# Altium project Main_Board.PrjPcb (part 10 of 44)

## Sheet Bank223.SchDoc: Bank223
size A3; Organization: Altium Limited; Address1: L3, 12a Rodborough Rd; Address2: Frenchs Forest; Address3: NSW; Address4: Australia 2086
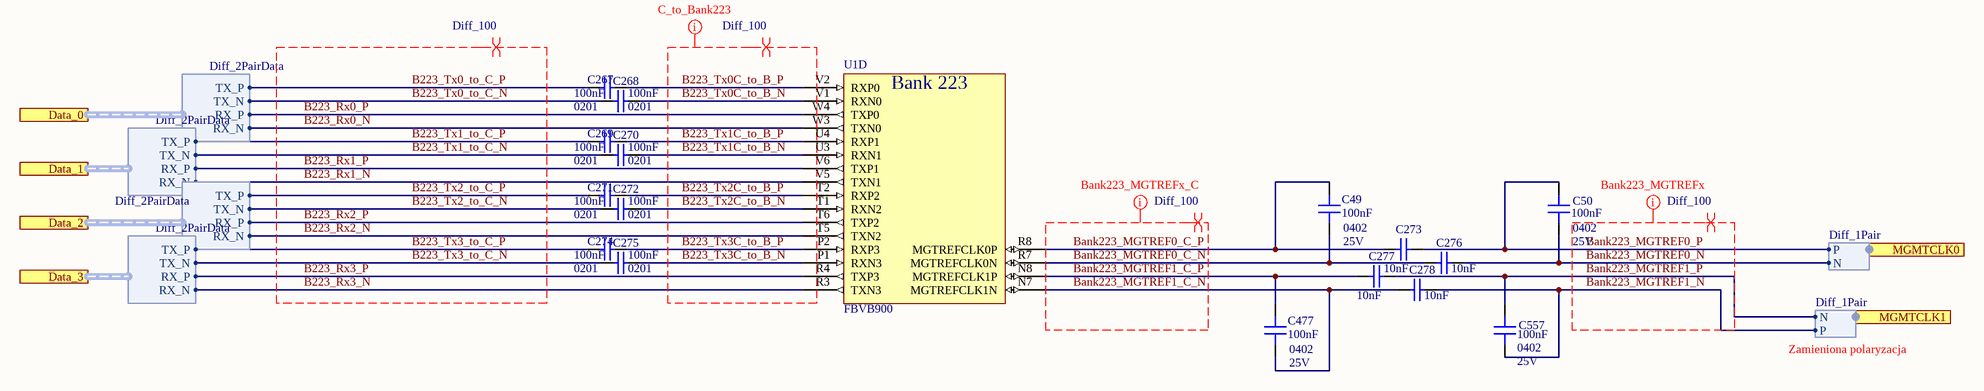
[diagram p15: Bank223.SchDoc]

### Parts
(Parts that share a designator on the sheet are numbered #1, #2 ... from top to bottom, then left to right.)
C49  100nF  Case/Package: 0402  Voltage Rating: 25V  [CAP 0402/1005 KK]
C50  100nF  Case/Package: 0402  Voltage Rating: 25V  [CAP 0402/1005 KK]
C267  100nF  Case/Package: 0201  [CAP 0201/0603 KK]
C268  100nF  Case/Package: 0201  [CAP 0201/0603 KK]
C269  100nF  Case/Package: 0201  [CAP 0201/0603 KK]
C270  100nF  Case/Package: 0201  [CAP 0201/0603 KK]
C271  100nF  Case/Package: 0201  [CAP 0201/0603 KK]
C272  100nF  Case/Package: 0201  [CAP 0201/0603 KK]
C273  10nF  [CAP 0201/0603 KK]
C274  100nF  Case/Package: 0201  [CAP 0201/0603 KK]
C275  100nF  Case/Package: 0201  [CAP 0201/0603 KK]
C276  10nF  [CAP 0201/0603 KK]
C277  10nF  [CAP 0201/0603 KK]
C278  10nF  [CAP 0201/0603 KK]
C477#1  100nF  Case/Package: 0402  Voltage Rating: 25V  [CAP 0402/1005 KK]
C557  100nF  Case/Package: 0402  Voltage Rating: 25V  [CAP 0402/1005 KK]
U1  FBVB900  [FBVB900 XX]  (part D of 23)

### Ports
Data_0 (harness Diff_2PairData), Data_1 (harness Diff_2PairData), Data_2 (harness Diff_2PairData), Data_3 (harness Diff_2PairData), MGMTCLK0 (harness Diff_1Pair), MGMTCLK1 (harness Diff_1Pair)

### Harnesses
Diff_1Pair: P, N
Diff_2PairData: RX_P, RX_N, TX_P, TX_N

### Nets
B223_Rx0_N: U1.W3(TXN0) ; port Data_0.RX_N
B223_Rx0_P: U1.W4(TXP0) ; port Data_0.RX_P
B223_Rx1_N: U1.V5(TXN1) ; port Data_1.RX_N
B223_Rx1_P: U1.V6(TXP1) ; port Data_1.RX_P
B223_Rx2_N: U1.T5(TXN2) ; port Data_2.RX_N
B223_Rx2_P: U1.T6(TXP2) ; port Data_2.RX_P
B223_Rx3_N: U1.R3(TXN3) ; port Data_3.RX_N
B223_Rx3_P: U1.R4(TXP3) ; port Data_3.RX_P
B223_Tx0_to_C_N: C268.1 ; port Data_0.TX_N
B223_Tx0_to_C_P: C267.1 ; port Data_0.TX_P
B223_Tx0C_to_B_N: C268.2 U1.V1(RXN0)
B223_Tx0C_to_B_P: C267.2 U1.V2(RXP0)
B223_Tx1_to_C_N: C270.1 ; port Data_1.TX_N
B223_Tx1_to_C_P: C269.1 ; port Data_1.TX_P
B223_Tx1C_to_B_N: C270.2 U1.U3(RXN1)
B223_Tx1C_to_B_P: C269.2 U1.U4(RXP1)
B223_Tx2_to_C_N: C272.1 ; port Data_2.TX_N
B223_Tx2_to_C_P: C271.1 ; port Data_2.TX_P
B223_Tx2C_to_B_N: C272.2 U1.T1(RXN2)
B223_Tx2C_to_B_P: C271.2 U1.T2(RXP2)
B223_Tx3_to_C_N: C275.1 ; port Data_3.TX_N
B223_Tx3_to_C_P: C274.1 ; port Data_3.TX_P
B223_Tx3C_to_B_N: C275.2 U1.P1(RXN3)
B223_Tx3C_to_B_P: C274.2 U1.P2(RXP3)
Bank223_MGTREF0_C_N: C49.1 C276.1 U1.R7(MGTREFCLK0N)
Bank223_MGTREF0_C_P: C49.2 C273.1 U1.R8(MGTREFCLK0P)
Bank223_MGTREF0_N: C50.1 C276.2 ; port MGMTCLK0.N
Bank223_MGTREF0_P: C50.2 C273.2 ; port MGMTCLK0.P
Bank223_MGTREF1_C_N: C278.1 C477#1.1 U1.N7(MGTREFCLK1N)
Bank223_MGTREF1_C_P: C277.1 C477#1.2 U1.N8(MGTREFCLK1P)
Bank223_MGTREF1_N: C278.2 C557.1 ; port MGMTCLK1.P
Bank223_MGTREF1_P: C277.2 C557.2 ; port MGMTCLK1.N

### Layout directives
differential pair; differential pair class Diff_100: B223_Rx0_N, B223_Rx0_P, B223_Rx1_N, B223_Rx1_P, B223_Rx2_N, B223_Rx2_P, B223_Rx3_N, B223_Rx3_P, B223_Tx0_to_C_N, B223_Tx0_to_C_P, B223_Tx0C_to_B_N, B223_Tx0C_to_B_P, B223_Tx1_to_C_N, B223_Tx1_to_C_P, B223_Tx1C_to_B_N, B223_Tx1C_to_B_P, B223_Tx2_to_C_N, B223_Tx2_to_C_P, B223_Tx2C_to_B_N, B223_Tx2C_to_B_P, B223_Tx3_to_C_N, B223_Tx3_to_C_P, B223_Tx3C_to_B_N, B223_Tx3C_to_B_P, Bank223_MGTREF0_C_N, Bank223_MGTREF0_C_P, Bank223_MGTREF0_N, Bank223_MGTREF0_P, Bank223_MGTREF1_C_N, Bank223_MGTREF1_C_P, Bank223_MGTREF1_N, Bank223_MGTREF1_P
net class C_to_Bank223: B223_Tx0C_to_B_N, B223_Tx0C_to_B_P, B223_Tx1C_to_B_N, B223_Tx1C_to_B_P, B223_Tx2C_to_B_N, B223_Tx2C_to_B_P, B223_Tx3C_to_B_N, B223_Tx3C_to_B_P
net class Bank223_MGTREFx_C: Bank223_MGTREF0_C_N, Bank223_MGTREF0_C_P, Bank223_MGTREF1_C_N, Bank223_MGTREF1_C_P
net class Bank223_MGTREFx: Bank223_MGTREF0_N, Bank223_MGTREF0_P, Bank223_MGTREF1_N, Bank223_MGTREF1_P

### Notes on the sheet
- Zamieniona polaryzacja
- Title
- Size:
- Date:
- A3
- Number:
- Time:
- Revision:
- Sheet
- of
- File:
- (in symbol FBVB900, part D) Bank 223

### Library data of the parts
C49 C50 C477#1 C557 = Capacitor: as C54 on sheet LTC6952; Supplier 1: Digi-Key; Supplier Part Number 1: 490-14603-1-ND; Stock 1: 89275; Pricing 1: 1 = 0,10000, 10 = 0,03400, 100 = 0,01520, 500 = 0,01088, 1000 = 0,00855, 2500 = 0,00778, 5000 = 0,00715 (USD); RoHS: Yes; Mount: Surface Mount; Weight: 0.000212oz; Case Code (Imperial): 0402; Case Code (Metric): 1005; Min Operating Temperature: -55°C; Max Operating Temperature: 125°C; Packaging: Tape and Reel; Capacitance: 100nF; Termination: SMD/SMT; Composition: Ceramic; Voltage Rating (DC): 25V; Package Quantity: 50000; Length: 0.039inch; Height: 0.5mm; Width: 0.5mm; Thickness: 0.022inch; ComponentLink1URL: http://www.mouser.com/ds/2/281/c02e-2905.pdf?src-supplier=Mouser; ComponentLink1Description: http://www.mouser.com/ds/2/281/c02e-2905.pdf?src-supplier=Mouser; ComponentLink2URL: http://search.murata.co.jp/Ceramy/image/img/A01X/G101/ENG/GRM155R71E104KE14-01.pdf?src-supplier=Digi-Key; ComponentLink2Description: http://search.murata.co.jp/Ceramy/image/img/A01X/G101/ENG/GRM155R71E104KE14-01.pdf?src-supplier=Digi-Key
C267-C272 C274 C275 = Capacitor: as C279 on sheet Bank224; Supplier 1: Digi-Key; Supplier Part Number 1: 490-9986-1-ND; RoHS: Yes; Category: Ceramic Capacitors; Stock 1: 519119; Pricing 1: 1=0,10000, 10=0,06000, 100=0,02670, 500=0,01906, 1000=0,01497, 2500=0,01361, 5000=0,01252 (USD); Mount: Surface Mount; Weight: 1.2E-05oz; Case Code (Metric): 0603; Min Operating Temperature: -55°C; Max Operating Temperature: 85°C; Capacitance: 100nF; Packaging: Tape and Reel; Voltage Rating: 16V; Dielectric: X5R; Termination: SMD/SMT; Voltage Rating (DC): 16V; Package Quantity: 15000; Length: 0.024inch; Height: 0.3mm; Width: 0.3mm; Thickness: 0.013inch; ComponentLink1URL: http://www.mouser.com/ds/2/281/c02e-2905.pdf?src-supplier=Mouser; ComponentLink1Description: http://www.mouser.com/ds/2/281/c02e-2905.pdf?src-supplier=Mouser; ComponentLink2URL: http://search.murata.co.jp/Ceramy/image/img/A01X/G101/ENG/GRM033R61C104ME84-01.pdf?src-supplier=Digi-Key; ComponentLink2Description: http://search.murata.co.jp/Ceramy/image/img/A01X/G101/ENG/GRM033R61C104ME84-01.pdf?src-supplier=Digi-Key
  C268 C270 C272 C275: Case Code (Imperial): 0201
C273 C276-C278 = Capacitor: as C285 on sheet Bank224; Supplier 1: Digi-Key; Supplier Part Number 1: 490-14453-1-ND; RoHS: No; Category: Ceramic Capacitors; Stock 1: 188777; Pricing 1: 1=0,10000, 10=0,01900, 100=0,00870, 500=0,00620, 1000=0,00487, 2500=0,00443, 5000=0,00407 (USD); Voltage Rating (DC): 16V; Dielectric: X7R; Capacitance: 10nF; Length: 600um; Width: 300um; Thickness: 300um; ComponentLink1URL: http://www.farnell.com/datasheets/2722745.pdf?src-supplier=Farnell; ComponentLink1Description: http://www.farnell.com/datasheets/2722745.pdf?src-supplier=Farnell; ComponentLink2URL: http://www.farnell.com/datasheets/2722745.pdf?src-supplier=Newark; ComponentLink2Description: http://www.farnell.com/datasheets/2722745.pdf?src-supplier=Newark; ComponentLink3URL: http://www.farnell.com/datasheets/2722745.pdf?src-supplier=Element14; ComponentLink3Description: http://www.farnell.com/datasheets/2722745.pdf?src-supplier=Element14; ComponentLink4URL: http://search.murata.co.jp/Ceramy/image/img/A01X/G101/ENG/GRM033R71C103KE14-01.pdf?src-supplier=Digi-Key; ComponentLink4Description: http://search.murata.co.jp/Ceramy/image/img/A01X/G101/ENG/GRM033R71C103KE14-01.pdf?src-supplier=Digi-Key
U1 = FBVB900: as U1 on sheet Ultrascale+_02; Supplier 1: Mouser; Supplier Part Number 1: 217-CZU4CG-1FBVB900E; Stock 1: 3; Pricing 1: 1=0,00000, 5=1060,70000 (USD); RoHS: No; Case/Package: FCBGA; Min Operating Temperature: 0°C; Max Operating Temperature: 100°C; Packaging: Tray; ComponentLink1URL: https://www.xilinx.com/support/documentation/data_sheets/ds891-zynq-ultrascale-plus-overview.pdf?src-supplier=Digi-Key; ComponentLink1Description: https://www.xilinx.com/support/documentation/data_sheets/ds891-zynq-ultrascale-plus-overview.pdf?src-supplier=Digi-Key; ComponentLink2URL: https://www.xilinx.com/support/documentation/data_sheets/ds925-zynq-ultrascale-plus.pdf?src-supplier=Digi-Key; ComponentLink2Description: https://www.xilinx.com/support/documentation/data_sheets/ds925-zynq-ultrascale-plus.pdf?src-supplier=Digi-Key; Supplier 2: Avnet; Supplier 3: Digi-Key; Supplier Part Number 2: XCZU4CG-1FBVB900E; Supplier Part Number 3: XCZU4CG-1FBVB900E-ND

## Sheet I2C_Bridge.SchDoc: I2C Bridge
size A4; DrawnBy: MrozW; Organization: Altium Limited; Address1: L3, 12a Rodborough Rd; Address2: Frenchs Forest; Address3: NSW; Address4: Australia 2086
Used 3 times, as channels HighSpeed/I2C_Bridge_PCIE, Ext_GPIO/I2C_Bridge_GPIO, SFP_Group+IMU/I2C_Bridge_SFP. Parts and nets are listed once, with the designators drawn on the sheet.
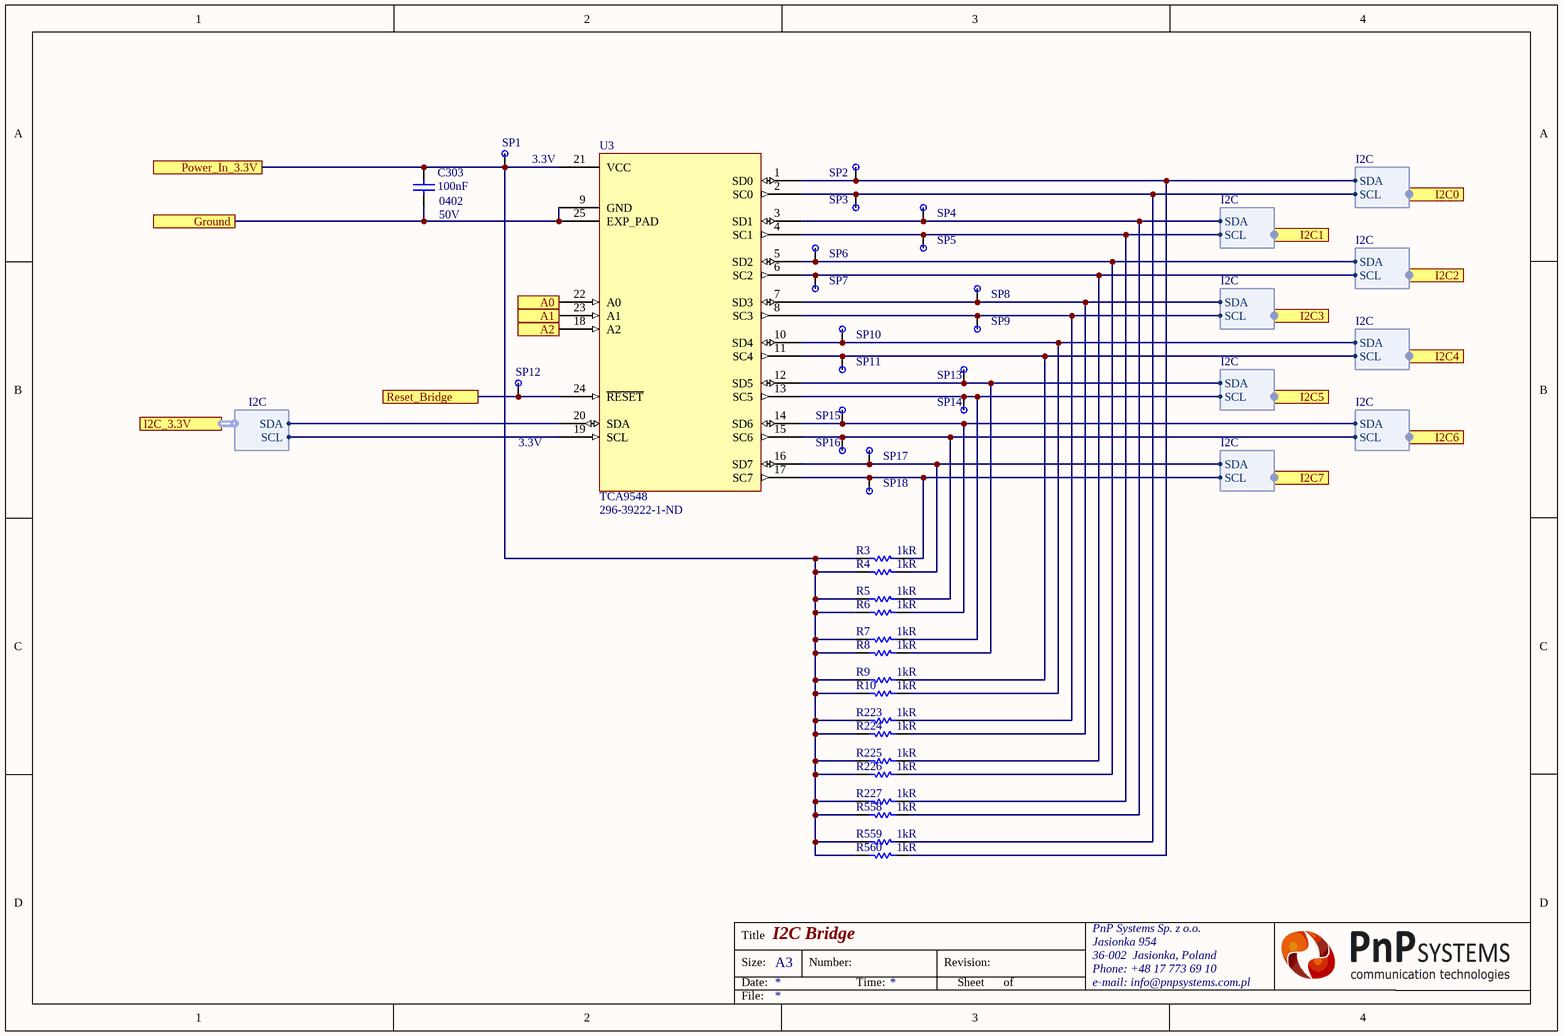
[diagram p16: I2C_Bridge.SchDoc]

### Parts
C303  100nF  Case Code (Imperial): 0402  Voltage: 50V  [CAP 0402/1005 KK]
R3  1kR  [RES 0402/1005 RF KK]
R4  1kR  [RES 0402/1005 RF KK]
R5  1kR  [RES 0402/1005 RF KK]
R6  1kR  [RES 0402/1005 RF KK]
R7  1kR  [RES 0402/1005 RF KK]
R8  1kR  [RES 0402/1005 RF KK]
R9  1kR  [RES 0402/1005 RF KK]
R10  1kR  [RES 0402/1005 RF KK]
R223  1kR  [RES 0402/1005 RF KK]
R224  1kR  [RES 0402/1005 RF KK]
R225  1kR  [RES 0402/1005 RF KK]
R226  1kR  [RES 0402/1005 RF KK]
R227  1kR  [RES 0402/1005 RF KK]
R558  1kR  [RES 0402/1005 RF KK]
R559  1kR  [RES 0402/1005 RF KK]
R560  1kR  [RES 0402/1005 RF KK]
SP1  SP  [MeasureTP]  (value not drawn)
SP2  SP  [MeasureTP]  (value not drawn)
SP3  SP  [MeasureTP]  (value not drawn)
SP4  SP  [MeasureTP]  (value not drawn)
SP5  SP  [MeasureTP]  (value not drawn)
SP6  SP  [MeasureTP]  (value not drawn)
SP7  SP  [MeasureTP]  (value not drawn)
SP8  SP  [MeasureTP]  (value not drawn)
SP9  SP  [MeasureTP]  (value not drawn)
SP10  SP  [MeasureTP]  (value not drawn)
SP11  SP  [MeasureTP]  (value not drawn)
SP12  SP  [MeasureTP]  (value not drawn)
SP13  SP  [MeasureTP]  (value not drawn)
SP14  SP  [MeasureTP]  (value not drawn)
SP15  SP  [MeasureTP]  (value not drawn)
SP16  SP  [MeasureTP]  (value not drawn)
SP17  SP  [MeasureTP]  (value not drawn)
SP18  SP  [MeasureTP]  (value not drawn)
U3  TCA9548  Supplier Part Number 1: 296-39222-1-ND  [TCA9548]

### Ports
A0, A1, A2, Ground, I2C0 (harness I2C), I2C1 (harness I2C), I2C2 (harness I2C), I2C3 (harness I2C), I2C4 (harness I2C), I2C5 (harness I2C), I2C6 (harness I2C), I2C7 (harness I2C), I2C_3.3V (harness I2C), Power_In_3.3V, Reset_Bridge

### Harnesses
I2C: SDA, SCL

### Nets
A0: U3.22(A0) ; port A0
A1: U3.23(A1) ; port A1
A2: U3.18(A2) ; port A2
Ground: C303.1 U3.9(GND) U3.25(EXP_PAD) ; port Ground
Power_In_3.3V: C303.2 R3.1 R4.1 R5.1 R6.1 R7.1 R8.1 R9.1 R10.1 R223.1 R224.1 R225.1 R226.1 R227.1 R558.1 R559.1 R560.1 SP1.1 U3.21(VCC) ; port Power_In_3.3V
Reset_Bridge: SP12.1 U3.24(~{RESET}) ; port Reset_Bridge
NetR3_2: R3.2 SP18.1 U3.17(SC7) ; port I2C7.SCL
NetR4_2: R4.2 SP17.1 U3.16(SD7) ; port I2C7.SDA
NetR5_2: R5.2 SP16.1 U3.15(SC6) ; port I2C6.SCL
NetR6_2: R6.2 SP15.1 U3.14(SD6) ; port I2C6.SDA
NetR7_2: R7.2 SP14.1 U3.13(SC5) ; port I2C5.SCL
NetR8_2: R8.2 SP13.1 U3.12(SD5) ; port I2C5.SDA
NetR9_2: R9.2 SP11.1 U3.11(SC4) ; port I2C4.SCL
NetR10_2: R10.2 SP10.1 U3.10(SD4) ; port I2C4.SDA
NetR223_2: R223.2 SP9.1 U3.8(SC3) ; port I2C3.SCL
NetR224_2: R224.2 SP8.1 U3.7(SD3) ; port I2C3.SDA
NetR225_2: R225.2 SP7.1 U3.6(SC2) ; port I2C2.SCL
NetR226_2: R226.2 SP6.1 U3.5(SD2) ; port I2C2.SDA
NetR227_2: R227.2 SP5.1 U3.4(SC1) ; port I2C1.SCL
NetR558_2: R558.2 SP4.1 U3.3(SD1) ; port I2C1.SDA
NetR559_2: R559.2 SP3.1 U3.2(SC0) ; port I2C0.SCL
NetR560_2: R560.2 SP2.1 U3.1(SD0) ; port I2C0.SDA
NetU3_19: U3.19(SCL) ; port I2C_3.3V.SCL
NetU3_20: U3.20(SDA) ; port I2C_3.3V.SDA

### Channels
HighSpeed/I2C_Bridge_PCIE: designators end in _I2C_Bridge_PCIE; ports A0=NetR449_2 A1=NetR451_2 A2=NetR453_2 Ground=B503_Ground Power_In_3.3V=3V3_RAIL Reset_Bridge=GPIOb_02.GPIO0
Ext_GPIO/I2C_Bridge_GPIO: designators end in _I2C_Bridge_GPIO; ports A0=NetR241_2 A1=NetR243_2 A2=NetR281_2 Ground=B503_Ground Power_In_3.3V=3V3_RAIL Reset_Bridge=NetSP12_I2C_Bridge_GPIO_1
SFP_Group+IMU/I2C_Bridge_SFP: designators end in _I2C_Bridge_SFP; ports A0=NetR469_2 A1=NetR471_2 A2=NetR473_2 Ground=B503_Ground Power_In_3.3V=3V3_RAIL Reset_Bridge=RST_brigde

### Notes on the sheet
- 3.3V
- Title
- Size:
- Date:
- A3
- Number:
- Time:
- Revision:
- Sheet
- of
- File:

### Library data of the parts
C303 = Capacitor: CAP CER 0.1UF 50V X5R 0402; Manufacturer: Murata; Manufacturer Part Number: GRM155R61H104KE14D; Dielectric Material: Ceramic; Dissipation Factor: 0.025%; Tolerance: 10%; Supplier 1: Digi-Key; Supplier Part Number 1: 490-10697-1-ND; RoHS: Yes; Category: Ceramic Capacitors; Stock 1: 435607; Pricing 1: 1=0,10000, 10=0,04600, 100=0,02050, 500=0,01464, 1000=0,01150, 2500=0,01045, 5000=0,00961 (USD); Mount: Surface Mount; Case/Package: 0402; Weight: 0.000212oz; Case Code (Metric): 1005; Min Operating Temperature: -55°C; Max Operating Temperature: 85°C; Capacitance: 100nF; Packaging: Tape and Reel; Voltage Rating: 50V; Dielectric: X5R; Termination: SMD/SMT; Composition: Ceramic; Voltage Rating (DC): 50V; Package Quantity: 10000; Length: 1mm; Height: 0.5mm; Width: 0.02inch; Thickness: 0.022inch; Depth: 0.5mm; REACH SVHC: No SVHC; Lead Free: Lead Free; ComponentLink1URL: http://www.farnell.com/datasheets/2079150.pdf?src-supplier=Farnell; ComponentLink1Description: http://www.farnell.com/datasheets/2079150.pdf?src-supplier=Farnell; ComponentLink2URL: http://www.mouser.com/ds/2/281/c02e-2905.pdf?src-supplier=Mouser; ComponentLink2Description: http://www.mouser.com/ds/2/281/c02e-2905.pdf?src-supplier=Mouser; ComponentLink3URL: http://www.farnell.com/datasheets/2079150.pdf?src-supplier=Element14; ComponentLink3Description: http://www.farnell.com/datasheets/2079150.pdf?src-supplier=Element14; ComponentLink4URL: http://search.murata.co.jp/Ceramy/image/img/A01X/G101/ENG/GRM155R61H104KE14-01.pdf?src-supplier=Digi-Key; ComponentLink4Description: http://search.murata.co.jp/Ceramy/image/img/A01X/G101/ENG/GRM155R61H104KE14-01.pdf?src-supplier=Digi-Key
R3-R10 R223-R227 R558-R560 = Resistor: as R124 on sheet Ultrascale+_02; Supplier 1: Digi-Key; Supplier Part Number 1: P1.00KLDKR-ND; Manufacturer: Panasonic; Manufacturer Part Number: ERJ-2RKF1001X; RoHS: Yes; Category: Chip SMD Resistors; Stock 1: 1864188; Pricing 1: 1=0,10000, 10=0,04300, 100=0,01740, 1000=0,00782, 2500=0,00678, 5000=0,00561 (USD); Mount: Surface Mount; Case/Package: 0402; Number of Pins: 2; Contact Plating: Tin; Case Code (Imperial): 0402; Case Code (Metric): 1005; Min Operating Temperature: -55°C; Max Operating Temperature: 155°C; Composition: Thick Film; Resistance: 1kR; Termination: SMD/SMT; Number of Terminations: 2; Military Standard: Not; Features: Automotive AEC-Q200; Packaging: Tape and Reel; Voltage Rating: 50V; Package Quantity: 1; Max Power Dissipation: 100mW; Working Voltage: 50V; Length: 1mm; Height: 0.35mm; Depth: 0.5mm; Width: 0.5mm; Radiation Hardening: No; Lead Free: Lead Free; REACH SVHC: No SVHC; ComponentLink1URL: https://datasheet.ciiva.com/11821/0900766b80f80784-11821203.pdf?src-supplier=RSComponents; ComponentLink1Description: https://datasheet.ciiva.com/11821/0900766b80f80784-11821203.pdf?src-supplier=RSComponents; ComponentLink2URL: https://datasheet.ciiva.com/7942/aoa0000ce2-7942426.pdf?src-supplier=Element14; ComponentLink2Description: https://datasheet.ciiva.com/7942/aoa0000ce2-7942426.pdf?src-supplier=Element14; ComponentLink3URL: https://datasheet.ciiva.com/16523/aoa0000ce2-16523834.pdf?src-supplier=Avnet+Asia; ComponentLink3Description: https://datasheet.ciiva.com/16523/aoa0000ce2-16523834.pdf?src-supplier=Avnet+Asia; ComponentLink4URL: https://datasheet.ciiva.com/17215/aoa0000ce2-17215308.pdf?src-supplier=Avnet+Europe; ComponentLink4Description: https://datasheet.ciiva.com/17215/aoa0000ce2-17215308.pdf?src-supplier=Avnet+Europe; ComponentLink5URL: https://datasheet.ciiva.com/22673/1678782-22673916.pdf?src-supplier=Element14; ComponentLink5Description: https://datasheet.ciiva.com/22673/1678782-22673916.pdf?src-supplier=Element14; ComponentLink6URL: https://datasheet.ciiva.com/28532/1678782-28532109.pdf?src-supplier=Element14; ComponentLink6Description: https://datasheet.ciiva.com/28532/1678782-28532109.pdf?src-supplier=Element14; ComponentLink7URL: https://datasheet.ciiva.com/16767/70260748-16767559.pdf?src-supplier=Allied+Electronics; ComponentLink7Description: https://datasheet.ciiva.com/16767/70260748-16767559.pdf?src-supplier=Allied+Electronics; ComponentLink8URL: https://datasheet.ciiva.com/9198/aoa0000ce2-9198920.pdf?src-supplier=Avnet; ComponentLink8Description: https://datasheet.ciiva.com/9198/aoa0000ce2-9198920.pdf?src-supplier=Avnet; ComponentLink9URL: https://datasheet.ciiva.com/16771/70260748-16771979.pdf?src-supplier=Allied+Electronics; ComponentLink9Description: https://datasheet.ciiva.com/16771/70260748-16771979.pdf?src-supplier=Allied+Electronics
U3 = TCA9548: 8X I2C Switch; Manufacturer: Texas Instruments; Manufacturer Part Number: TCA9548ARGER; Max Supply Voltage: 5.5V; Min Supply Voltage: 1.65V; On-State Resistance: 70R; Max Supply Current: 80uA; Supply Type: Single; Independent Circuits: 1; Propagation Delay: 1ns; Supplier 1: Digi-Key; Stock 1: 1611; Pricing 1: 1 = 1,55000, 10 = 1,39200, 100 = 1,11890, 500 = 0,91928, 1000 = 0,76169 (USD); RoHS: Yes; Mount: Surface Mount; Case/Package: VQFN; Number of Pins: 24; Weight: 0.001926oz; Min Operating Temperature: -40°C; Max Operating Temperature: 85°C; Package Quantity: 3000; Packaging: Tape and Reel; Radiation Hardening: No; REACH SVHC: No SVHC; Lead Free: Lead Free; ComponentLink1URL: https://datasheet.ciiva.com/30010/tca9548a-30010277.pdf?src-supplier=Avnet; ComponentLink1Description: https://datasheet.ciiva.com/30010/tca9548a-30010277.pdf?src-supplier=Avnet; ComponentLink2URL: https://datasheet.ciiva.com/29616/tca9548a-29616682.pdf?src-supplier=Digi-Key; ComponentLink2Description: https://datasheet.ciiva.com/29616/tca9548a-29616682.pdf?src-supplier=Digi-Key